# Altium schematic sheet 02_POWER_REGULATION.SchDoc
size A3
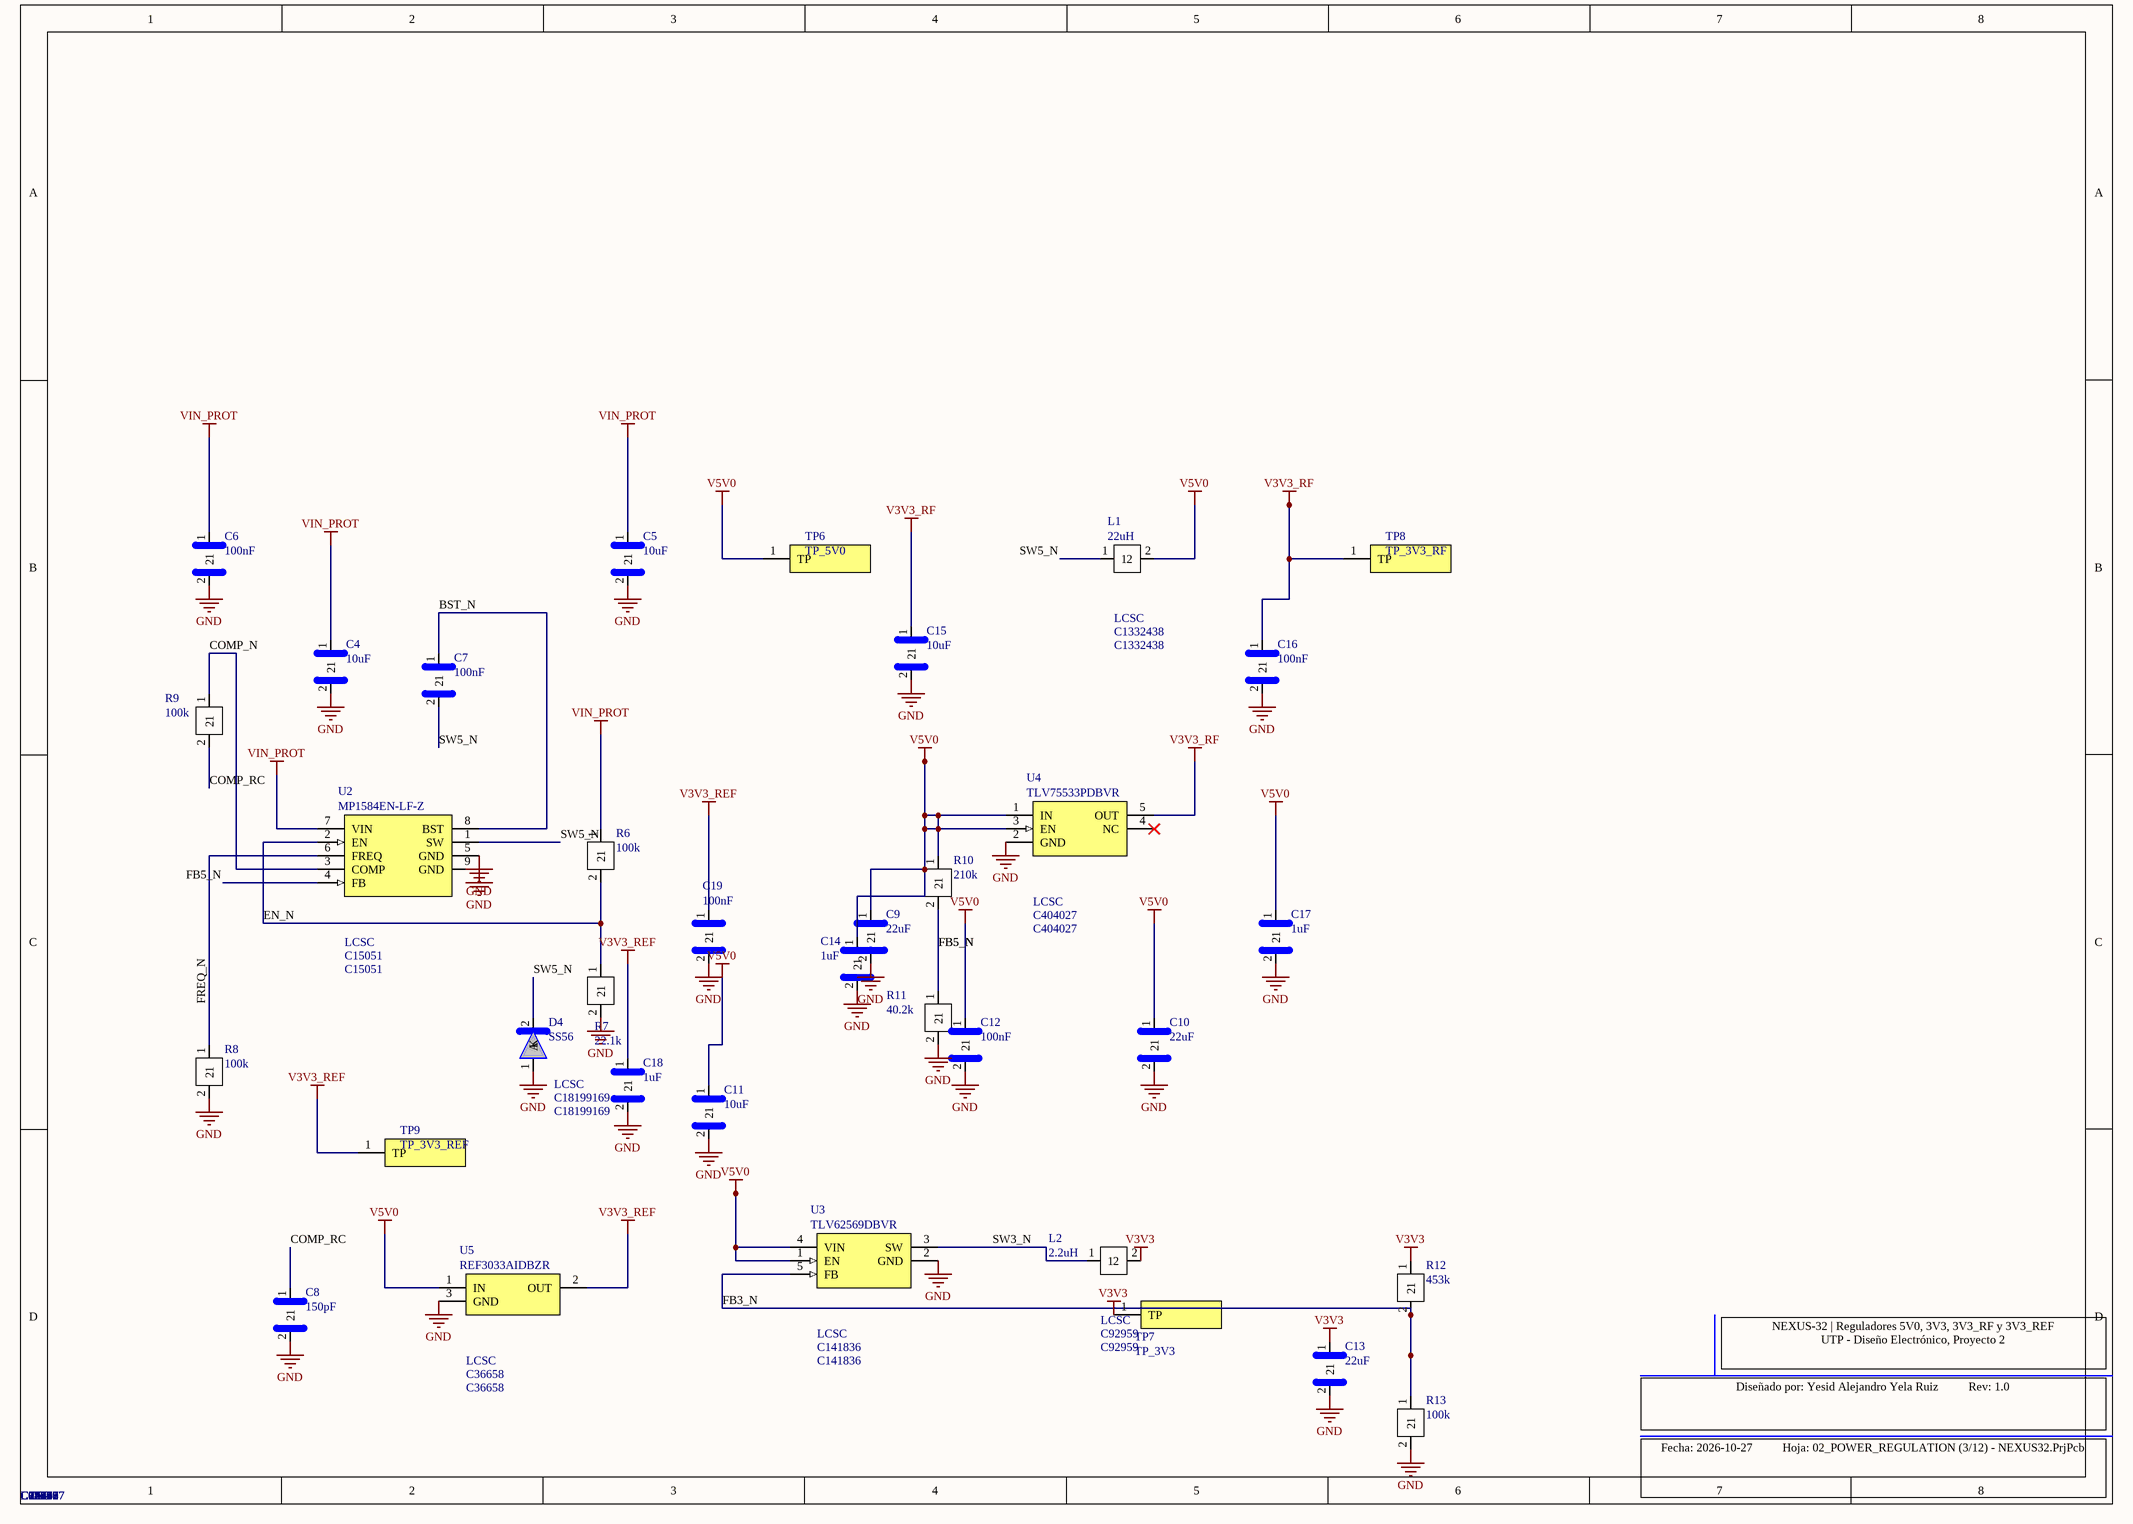
[diagram p0: 02_POWER_REGULATION.SchDoc]

## Parts
C4  10uF  Supplier 1: LCSC  Supplier Part Number 1: C138687  [C_1210]
C5  10uF  Supplier 1: LCSC  Supplier Part Number 1: C138687  [C_1210]
C6  100nF  Supplier 1: LCSC  Supplier Part Number 1: C14663  [R_0603]
C7  100nF  Supplier 1: LCSC  Supplier Part Number 1: C14663  [R_0603]
C8  150pF  Supplier 1: LCSC  Supplier Part Number 1: C37298  [R_0603]
C9  22uF  Supplier 1: LCSC  Supplier Part Number 1: C98190  [C_0805]
C10  22uF  Supplier 1: LCSC  Supplier Part Number 1: C98190  [C_0805]
C11  10uF  Supplier 1: LCSC  Supplier Part Number 1: C1713  [C_0805]
C12  100nF  Supplier 1: LCSC  Supplier Part Number 1: C14663  [R_0603]
C13  22uF  Supplier 1: LCSC  Supplier Part Number 1: C29277  [C_0805]
C14  1uF  Supplier 1: LCSC  Supplier Part Number 1: C15849  [R_0603]
C15  10uF  Supplier 1: LCSC  Supplier Part Number 1: C19702  [R_0603]
C16  100nF  Supplier 1: LCSC  Supplier Part Number 1: C14663  [R_0603]
C17  1uF  Supplier 1: LCSC  Supplier Part Number 1: C15849  [R_0603]
C18  1uF  Supplier 1: LCSC  Supplier Part Number 1: C15849  [R_0603]
C19  100nF  Supplier 1: LCSC  Supplier Part Number 1: C14663  [R_0603]
D4  SS56  Supplier 1: LCSC  Supplier Part Number 1: C18199169  [D_SMA]
L1  22uH  Supplier 1: LCSC  Supplier Part Number 1: C1332438  [L_SRP7050TA]
L2  2.2uH  Supplier 1: LCSC  Supplier Part Number 1: C92959  [L_NRS4018]
R6  100k  Supplier 1: LCSC  Supplier Part Number 1: C25803  [R_0603]
R7  22.1k  Supplier 1: LCSC  Supplier Part Number 1: C25961  [R_0603]
R8  100k  Supplier 1: LCSC  Supplier Part Number 1: C25803  [R_0603]
R9  100k  Supplier 1: LCSC  Supplier Part Number 1: C25803  [R_0603]
R10  210k  Supplier 1: LCSC  Supplier Part Number 1: C22952  [R_0603]
R11  40.2k  Supplier 1: LCSC  Supplier Part Number 1: C12447  [R_0603]
R12  453k  Supplier 1: LCSC  Supplier Part Number 1: C25818  [R_0603]
R13  100k  Supplier 1: LCSC  Supplier Part Number 1: C25803  [R_0603]
TP6  TP_5V0  [TP_PAD_1.5mm]
TP7  TP_3V3  [TP_PAD_1.5mm]
TP8  TP_3V3_RF  [TP_PAD_1.5mm]
TP9  TP_3V3_REF  [TP_PAD_1.5mm]
U2  MP1584EN-LF-Z  Supplier 1: LCSC  Supplier Part Number 1: C15051  [SOIC-8-EP_MP1584]
U3  TLV62569DBVR  Supplier 1: LCSC  Supplier Part Number 1: C141836  [SOT-23-5_DBV]
U4  TLV75533PDBVR  Supplier 1: LCSC  Supplier Part Number 1: C404027  [SOT-23-5_DBV]
U5  REF3033AIDBZR  Supplier 1: LCSC  Supplier Part Number 1: C36658  [SOT-23-3_DBZ]

## Nets
GND: C4.2 C5.2 C6.2 C8.2 C9.2 C10.2 C11.2 C12.2 C13.2 C14.2 C15.2 C16.2 C17.2 C18.2 C19.2 D4.1(A) R7.2 R8.2 R11.2 R13.2 U2.5(GND) U2.9(GND) U3.2(GND) U4.2(GND) U5.3(GND)
V3V3: C13.1 L2.2 R12.1 TP7.1(TP)
V3V3_REF: C18.1 C19.1 TP9.1(TP) U5.2(OUT)
V3V3_RF: C15.1 C16.1 TP8.1(TP) U4.5(OUT)
V5V0: C9.1 C10.1 C11.1 C12.1 C14.1 C17.1 L1.2 R10.1 TP6.1(TP) U3.1(EN) U3.4(VIN) U4.1(IN) U4.3(EN) U5.1(IN)
VIN_PROT: C4.1 C5.1 C6.1 R6.1 U2.7(VIN)
BST_N: C7.1 U2.8(BST)
COMP_N: R9.1 U2.3(COMP)
COMP_RC: C8.1 R9.2
EN_N: R6.2 R7.1 U2.2(EN)
FB3_N: R12.2 R13.1 U3.5(FB)
FB5_N: R10.2 R11.1 U2.4(FB)
FREQ_N: R8.1 U2.6(FREQ)
SW3_N: L2.1 U3.3(SW)
SW5_N: C7.2 D4.2(K) L1.1 U2.1(SW)

Not connected (* = marked no-connect by the designer): U4 4(NC)*

## Notes on the sheet
- NEXUS-32 | Reguladores 5V0, 3V3, 3V3_RF y 3V3_REF
  UTP - Diseño Electrónico, Proyecto 2
- Diseñado por: Yesid Alejandro Yela Ruiz          Rev: 1.0
- Fecha: 2026-10-27          Hoja: 02_POWER_REGULATION (3/12) - NEXUS32.PrjPcb

## Library data of the parts
C4 C5 = CAP_1210: Condensador ceramico SMD 1210; Manufacturer: Samsung; Manufacturer Part Number: CL32B106KBJNNNE; Datasheet: https://wmsc.lcsc.com/wmsc/upload/file/pdf/v2/lcsc/2206010045_UNI-ROYAL-Uniroyal-Elec-0603WAF1002T5E_C25804.pdf; LCSC Part #: C138687
C6 C7 C12 C16 C19 = CAP_0603: Condensador ceramico SMD 0603; Manufacturer: YAGEO; Manufacturer Part Number: CC0603KRX7R9BB104; Datasheet: https://wmsc.lcsc.com/wmsc/upload/file/pdf/v2/lcsc/2206010045_UNI-ROYAL-Uniroyal-Elec-0603WAF1002T5E_C25804.pdf; LCSC Part #: C14663
C8 = CAP_0603: Condensador ceramico SMD 0603; Manufacturer: Samsung; Manufacturer Part Number: CL10C151JB8NNNC; Datasheet: https://wmsc.lcsc.com/wmsc/upload/file/pdf/v2/lcsc/2206010045_UNI-ROYAL-Uniroyal-Elec-0603WAF1002T5E_C25804.pdf; LCSC Part #: C37298
C9 C10 = CAP_0805: Condensador ceramico SMD 0805; Manufacturer: Samsung; Manufacturer Part Number: CL21A226MOQNNNE; Datasheet: https://wmsc.lcsc.com/wmsc/upload/file/pdf/v2/lcsc/2206010045_UNI-ROYAL-Uniroyal-Elec-0603WAF1002T5E_C25804.pdf; LCSC Part #: C98190
C11 = CAP_0805: Condensador ceramico SMD 0603; Manufacturer: Samsung; Manufacturer Part Number: CL21A106KOQNNNE; Datasheet: https://wmsc.lcsc.com/wmsc/upload/file/pdf/v2/lcsc/2206010045_UNI-ROYAL-Uniroyal-Elec-0603WAF1002T5E_C25804.pdf; LCSC Part #: C1713
C13 = CAP_0805: Condensador ceramico SMD 0805; Manufacturer: Samsung; Manufacturer Part Number: CL21A226MPQNNNE; Datasheet: https://wmsc.lcsc.com/wmsc/upload/file/pdf/v2/lcsc/2206010045_UNI-ROYAL-Uniroyal-Elec-0603WAF1002T5E_C25804.pdf; LCSC Part #: C29277
C14 C17 C18 = CAP_0603: Condensador ceramico SMD 0603; Manufacturer: Samsung; Manufacturer Part Number: CL10A105KB8NNNC; Datasheet: https://wmsc.lcsc.com/wmsc/upload/file/pdf/v2/lcsc/2206010045_UNI-ROYAL-Uniroyal-Elec-0603WAF1002T5E_C25804.pdf; LCSC Part #: C15849
C15 = CAP_0603: Condensador ceramico SMD 0603; Manufacturer: Samsung; Manufacturer Part Number: CL10A106KP8NNNC; Datasheet: https://wmsc.lcsc.com/wmsc/upload/file/pdf/v2/lcsc/2206010045_UNI-ROYAL-Uniroyal-Elec-0603WAF1002T5E_C25804.pdf; LCSC Part #: C19702
D4 = SS56: Diodo Schottky 40V 5A SMA (MDD SS54); Manufacturer: hongjiacheng; Manufacturer Part Number: SS56; LCSC Part #: C18199169; Datasheet: https://wmsc.lcsc.com/wmsc/upload/file/pdf/v2/lcsc/2407101107_MDD-Microdiode-Semiconductor-SS54_C22452.pdf
L1 = IND_SRP7050TA: Inductor de potencia 22uH 7.3x6.6mm (Bourns SRP7050TA-220M); Manufacturer: Bourns; Manufacturer Part Number: SRP7050TA-220M; LCSC Part #: C1332438; Datasheet: https://wmsc.lcsc.com/wmsc/upload/file/pdf/v2/lcsc/2304140030_BOURNS-SRP7050TA-220M_C1332438.pdf
L2 = IND_NRS4018: Inductor de potencia 2.2uH 4x4mm (Taiyo Yuden NRS4018T2R2MDGJ); Manufacturer: Taiyo Yuden; Manufacturer Part Number: NRS4018T2R2MDGJ; LCSC Part #: C92959; Datasheet: https://wmsc.lcsc.com/wmsc/upload/file/pdf/v2/lcsc/2211282300_Taiyo-Yuden-NRS4018T2R2MDGJ_C92959.pdf
R6 R8 R9 R13 = RES_0603: Resistencia SMD 0603; Manufacturer: UNI-ROYAL; Manufacturer Part Number: 0603WAF1003T5E; Datasheet: https://wmsc.lcsc.com/wmsc/upload/file/pdf/v2/lcsc/2206010045_UNI-ROYAL-Uniroyal-Elec-0603WAF1002T5E_C25804.pdf; LCSC Part #: C25803
R7 = RES_0603: Resistencia SMD 0603; Manufacturer: UNI-ROYAL; Manufacturer Part Number: 0603WAF2212T5E; Datasheet: https://wmsc.lcsc.com/wmsc/upload/file/pdf/v2/lcsc/2206010045_UNI-ROYAL-Uniroyal-Elec-0603WAF1002T5E_C25804.pdf; LCSC Part #: C25961
R10 = RES_0603: Resistencia SMD 0603; Manufacturer: UNI-ROYAL; Manufacturer Part Number: 0603WAF2103T5E; Datasheet: https://wmsc.lcsc.com/wmsc/upload/file/pdf/v2/lcsc/2206010045_UNI-ROYAL-Uniroyal-Elec-0603WAF1002T5E_C25804.pdf; LCSC Part #: C22952
R11 = RES_0603: Resistencia SMD 0603; Manufacturer: UNI-ROYAL; Manufacturer Part Number: 0603WAF4022T5E; Datasheet: https://wmsc.lcsc.com/wmsc/upload/file/pdf/v2/lcsc/2206010045_UNI-ROYAL-Uniroyal-Elec-0603WAF1002T5E_C25804.pdf; LCSC Part #: C12447
R12 = RES_0603: Resistencia SMD 0603; Manufacturer: UNI-ROYAL; Manufacturer Part Number: 0603WAF4533T5E; Datasheet: https://wmsc.lcsc.com/wmsc/upload/file/pdf/v2/lcsc/2206010045_UNI-ROYAL-Uniroyal-Elec-0603WAF1002T5E_C25804.pdf; LCSC Part #: C25818
TP6-TP9 = TESTPOINT: Punto de prueba, pad desnudo de 1.5mm sin montaje; Manufacturer: n/a; Manufacturer Part Number: TP_PAD_1.5mm; Datasheet: https://wmsc.lcsc.com/wmsc/upload/file/pdf/v2/lcsc/2206010045_UNI-ROYAL-Uniroyal-Elec-0603WAF1002T5E_C25804.pdf
U2 = MP1584EN-LF-Z: Reductor 3A 28V 1.5MHz SOIC8E con pad expuesto (MPS MP1584EN-LF-Z); Manufacturer: Monolithic Power Systems; Manufacturer Part Number: MP1584EN-LF-Z; LCSC Part #: C15051; Datasheet: https://wmsc.lcsc.com/wmsc/upload/file/pdf/v2/lcsc/2401301656_Monolithic-Power-Systems-MP1584EN-LF-P_C7304223.pdf
U3 = TLV62569DBVR: Reductor sincrono 2A 2.5-5.5V SOT-23-5 (TI TLV62569DBVR); Manufacturer: Texas Instruments; Manufacturer Part Number: TLV62569DBVR; LCSC Part #: C141836; Datasheet: https://www.ti.com/lit/ds/symlink/tlv62569.pdf
U4 = TLV75533PDBVR: LDO 500mA 3.3V SOT-23-5 (TI TLV75533PDBVR); Manufacturer: Texas Instruments; Manufacturer Part Number: TLV75533PDBVR; LCSC Part #: C404027; Datasheet: https://wmsc.lcsc.com/wmsc/upload/file/pdf/v2/lcsc/1912111437_Texas-Instruments-TLV75533PDBVR_C404027.pdf
U5 = REF3033AIDBZR: Referencia de tension 3.3V 0.2% SOT-23-3 (TI REF3033AIDBZR); Manufacturer: Texas Instruments; Manufacturer Part Number: REF3033AIDBZR; LCSC Part #: C36658; Datasheet: https://wmsc.lcsc.com/wmsc/upload/file/pdf/v2/lcsc/2304140030_Texas-Instruments-REF3033AIDBZR_C36658.pdf